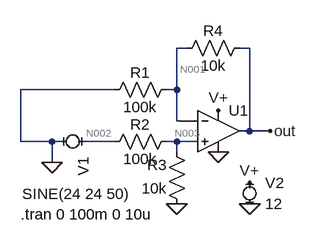
[diagram p0: schematic Draft1.asc]
Draft1.asc, the LTspice schematic file:
Version 4
SHEET 1 880 680
WIRE 160 32 144 32
WIRE 256 32 240 32
WIRE 48 96 -96 96
WIRE 144 96 144 32
WIRE 144 96 128 96
WIRE 144 144 144 96
WIRE 176 144 144 144
WIRE 256 160 256 32
WIRE 256 160 240 160
WIRE 288 160 256 160
WIRE -96 176 -96 96
WIRE -48 176 -96 176
WIRE -32 176 -48 176
WIRE 48 176 0 176
WIRE 144 176 128 176
WIRE 176 176 144 176
WIRE 144 192 144 176
WIRE -48 208 -48 176
FLAG 144 272 0
FLAG 208 192 0
FLAG -48 208 0
FLAG 208 128 V+
FLAG 256 240 V+
FLAG 256 272 0
FLAG 288 160 out
SYMBOL Opamps\\UniversalOpamp2 208 160 R0
SYMATTR InstName U1
SYMBOL res 144 80 R90
WINDOW 0 5 56 VBottom 2
WINDOW 3 27 56 VTop 2
SYMATTR InstName R1
SYMATTR Value 100k
SYMBOL res 144 160 R90
WINDOW 0 5 56 VBottom 2
WINDOW 3 27 56 VTop 2
SYMATTR InstName R2
SYMATTR Value 100k
SYMBOL res 160 288 R180
WINDOW 0 31 76 Left 2
WINDOW 3 31 40 Left 2
SYMATTR InstName R3
SYMATTR Value 10k
SYMBOL res 256 16 R90
WINDOW 0 5 56 VBottom 2
WINDOW 3 27 56 VTop 2
SYMATTR InstName R4
SYMATTR Value 10k
SYMBOL MiniSyms4\\voltage- -16 176 R90
WINDOW 3 81 78 VLeft 2
WINDOW 123 0 0 Left 2
WINDOW 39 0 0 Left 2
SYMATTR Value SINE(24 24 50)
SYMATTR InstName V1
SYMBOL MiniSyms4\\voltage- 256 256 R0
WINDOW 123 0 0 Left 2
WINDOW 39 0 0 Left 2
SYMATTR InstName V2
SYMATTR Value 12
TEXT -96 288 Left 2 !.tran 0 100m 0 10u

The netlist it stands for:
* Draft1.asc
XU1 N003 N001 V+ 0 out level.2 Avol=1Meg GBW=10Meg Slew=10Meg ilimit=25m rail=0 Vos=0 phimargin=45 en=0 enk=0 in=0 ink=0 Rin=500Meg  ; pins IN+ IN- V+ V- OUT
R1 N001 0 100k
R2 N003 N002 100k
R3 0 N003 10k
R4 out N001 10k
V1 N002 0 SINE(24 24 50)
V2 V+ 0 12
.tran 0 100m 0 10u
.lib UniversalOpamps2.sub
.backanno
.end

* Results of the author's LTspice run, read from the files saved beside the schematic
* Operating Point, zero values left out:
*   V(out) = 2.4 V
*   V(v+) = 12 V
*   V(n001) = 2.182 V
*   V(n003) = 2.182 V
*   V(n002) = 24 V
*   I(R4) = 21.81 µA
*   I(R3) = -218.2 µA
*   I(R2) = -218.2 µA
*   I(R1) = 21.82 µA
*   I(V2) = -491 µA
*   I(V1) = -218.2 µA
*   Ix(u1:1) = -7.636 nA
*   Ix(u1:2) = -7.636 nA
*   Ix(u1:3) = 491 µA
*   Ix(u1:4) = -469.2 µA
*   Ix(u1:5) = -21.81 µA
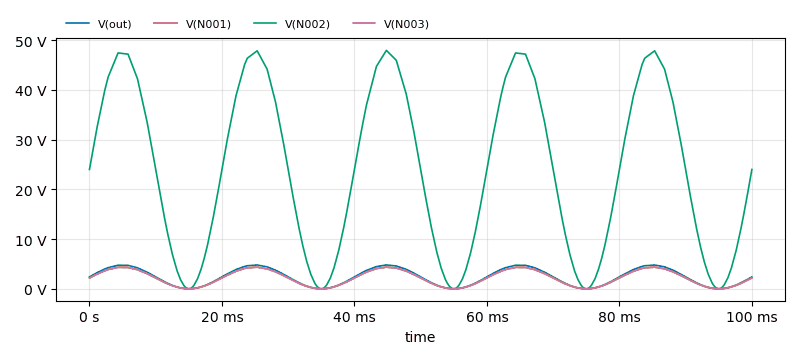
[diagram p1: Transient Analysis of Draft1.asc, plotted from the saved traces]
* Transient Analysis, 1 run:
*   V(out): min 4.295 mV, max 4.796 V, average 2.39 V, rms 2.93 V, last 2.4 V
*   V(N001): min 4.014 mV, max 4.36 V, average 2.173 V, rms 2.664 V, last 2.182 V
*   V(N002): min 70.65 µV, max 47.96 V, average 23.9 V, rms 29.3 V, last 24 V
*   V(N003): min 115.5 µV, max 4.36 V, average 2.173 V, rms 2.664 V, last 2.182 V